# Altium schematic sheet MCU.SchDoc: MCU
size A2; DocumentNumber: 4; SheetNumber: 4; SheetTotal: 9
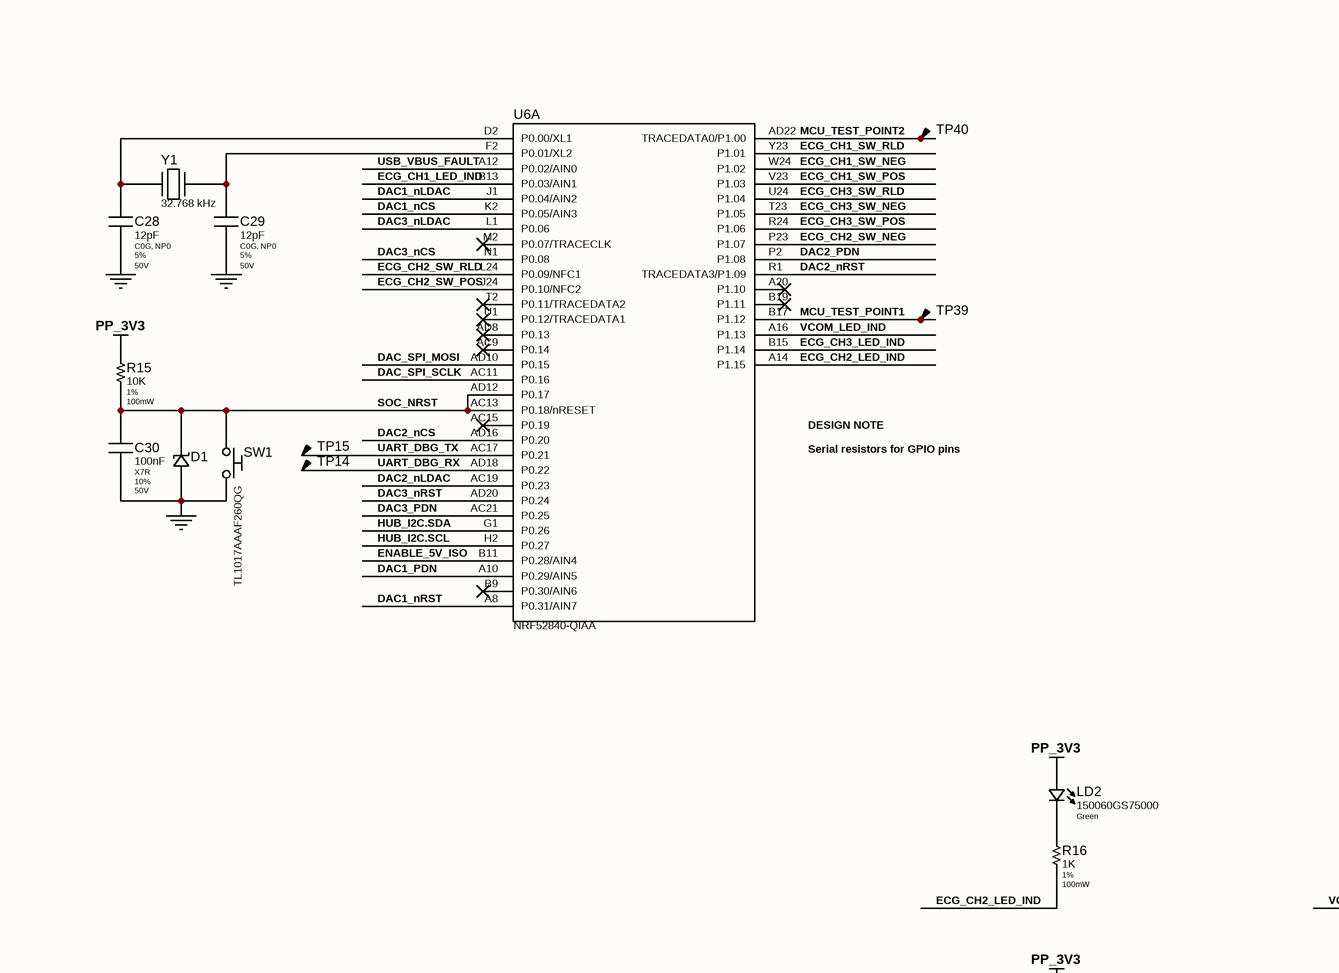
[diagram p0: MCU.SchDoc, top left]
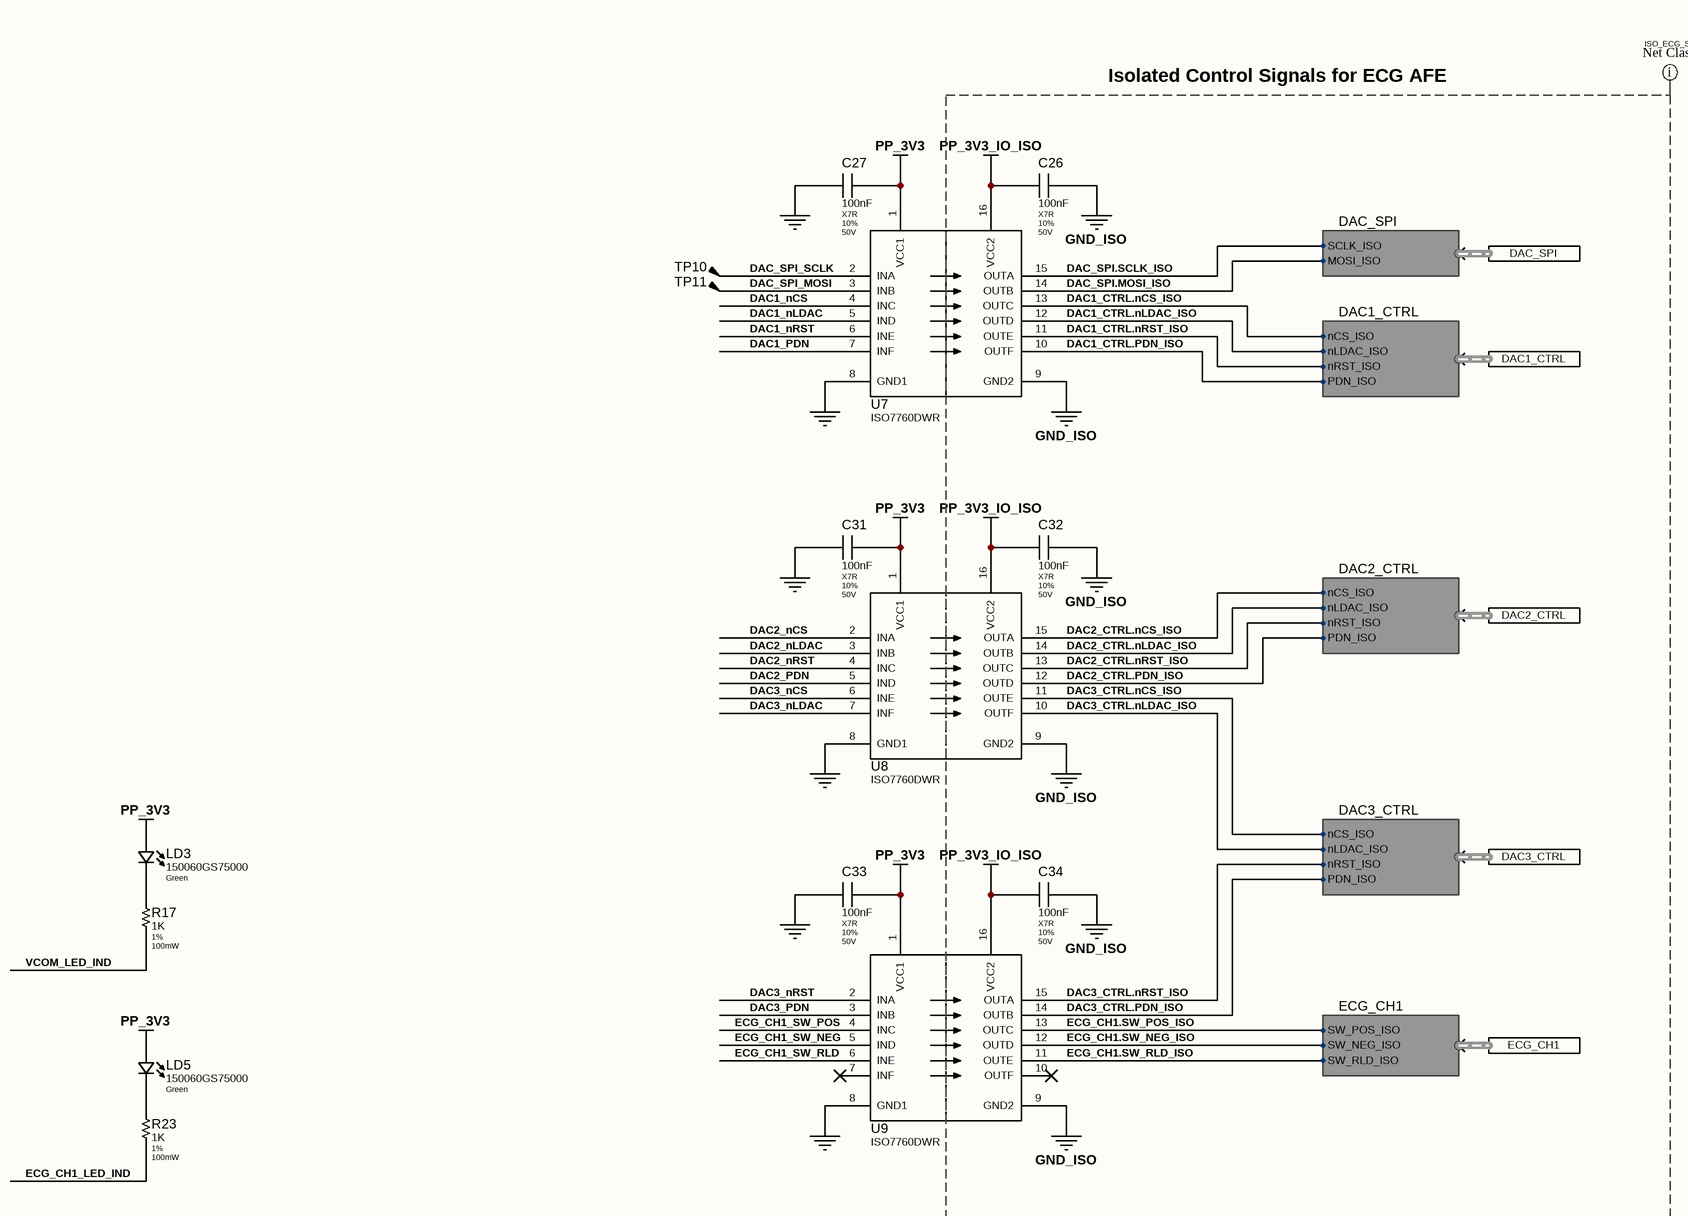
[diagram p1: MCU.SchDoc, top right]
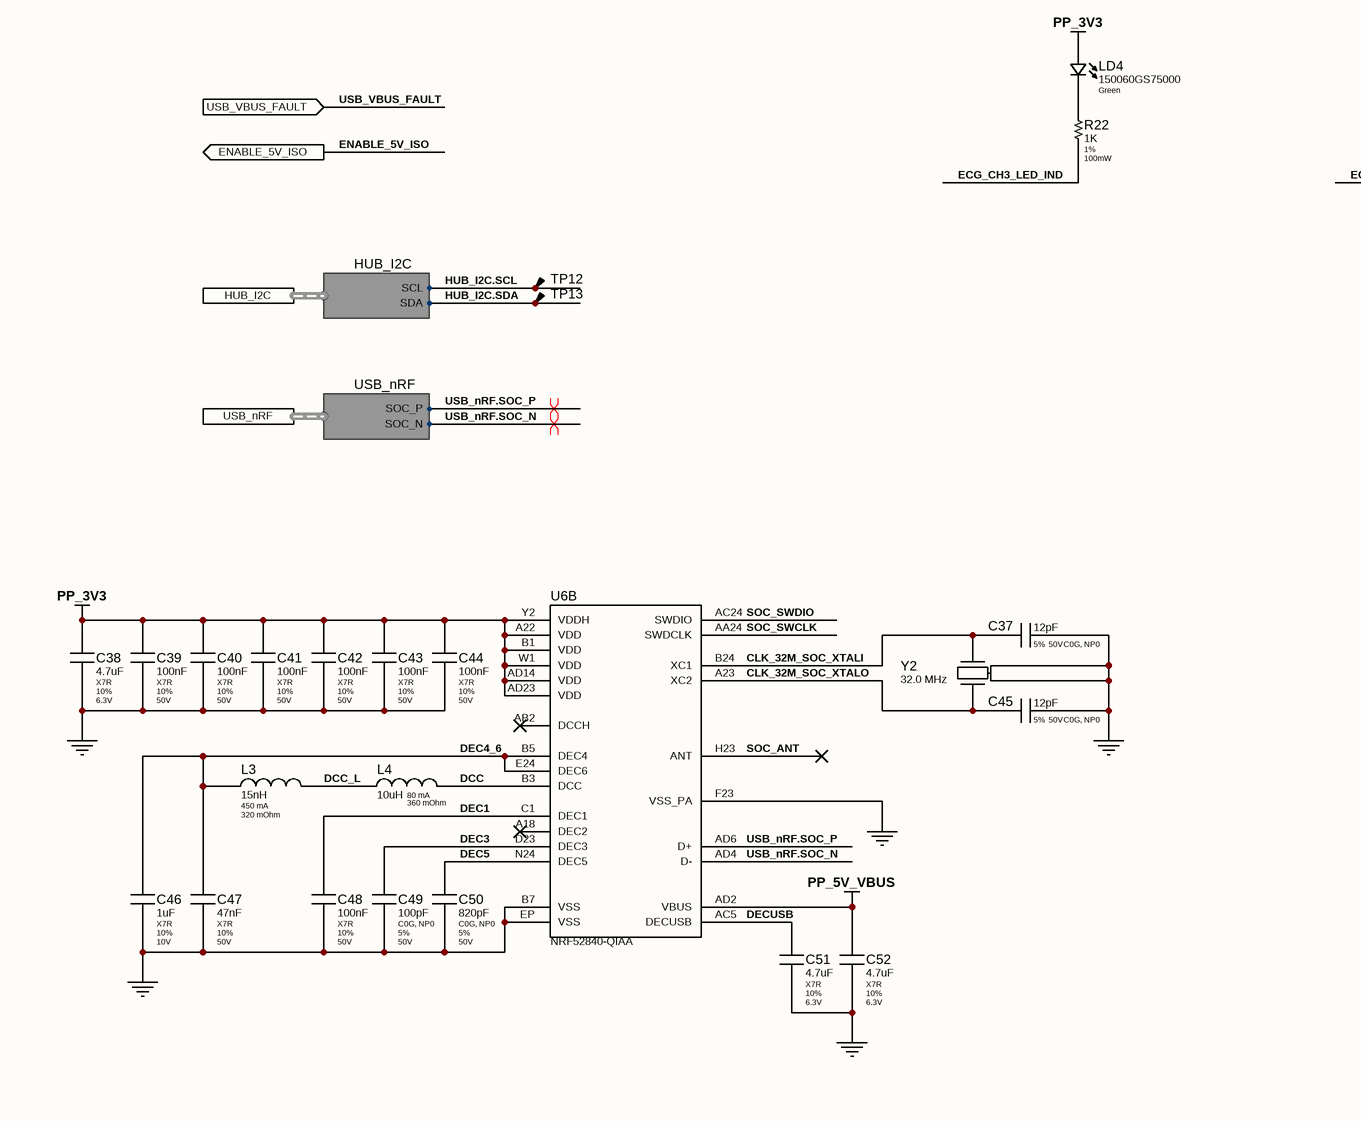
[diagram p2: MCU.SchDoc, bottom left]
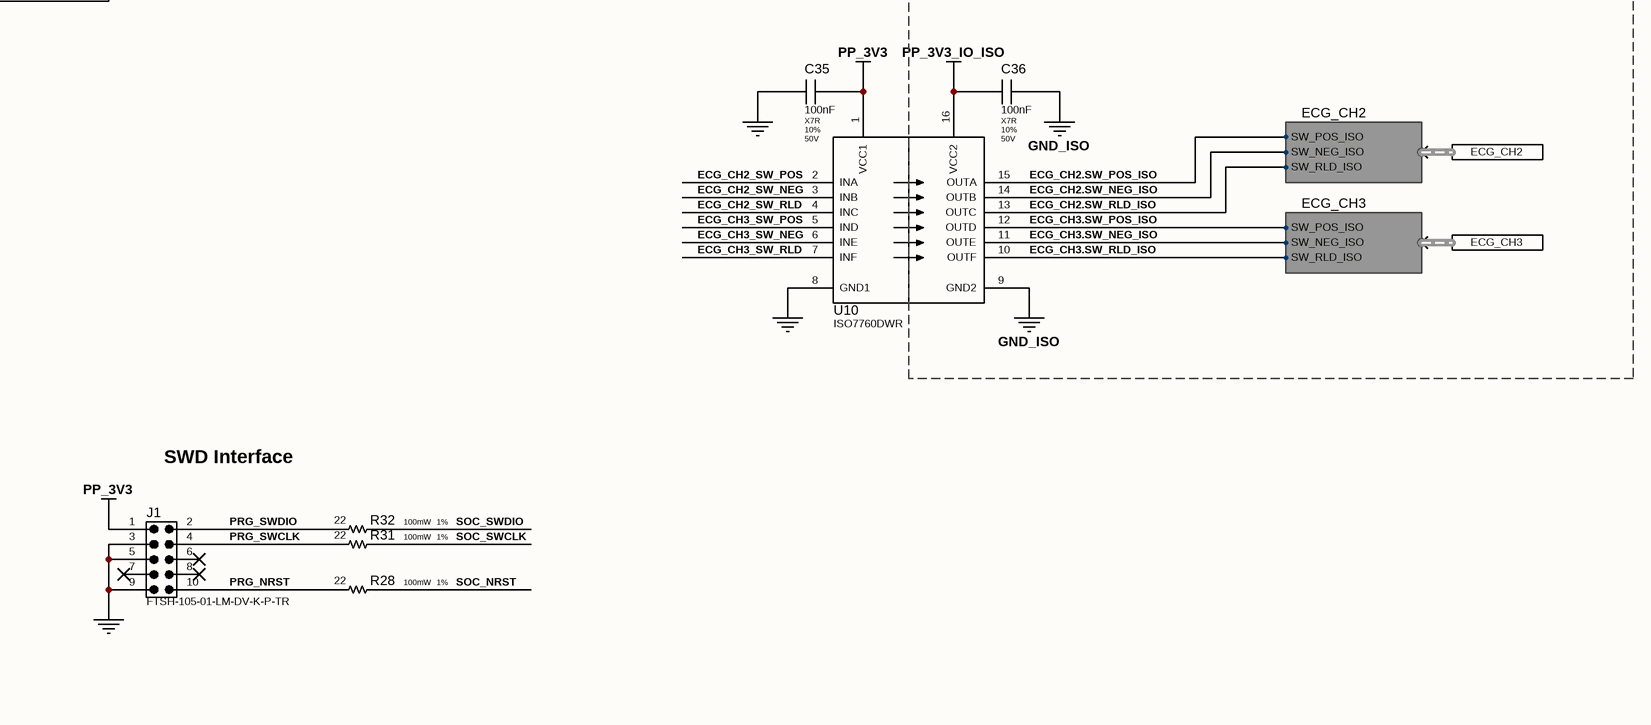
[diagram p3: MCU.SchDoc, bottom right]

## Parts
C26  100nF  Dielectric: X7R  Tolerance: 10%  Voltage: 50V  [MLCC-0402-L]
C27  100nF  Dielectric: X7R  Tolerance: 10%  Voltage: 50V  [MLCC-0402-L]
C28  12pF  Dielectric: C0G, NP0  Tolerance: 5%  Voltage: 50V  [MLCC-0402-N]
C29  12pF  Dielectric: C0G, NP0  Tolerance: 5%  Voltage: 50V  [MLCC-0402-N]
C30  100nF  Dielectric: X7R  Tolerance: 10%  Voltage: 50V  [MLCC-0402-L]
C31  100nF  Dielectric: X7R  Tolerance: 10%  Voltage: 50V  [MLCC-0402-L]
C32  100nF  Dielectric: X7R  Tolerance: 10%  Voltage: 50V  [MLCC-0402-L]
C33  100nF  Dielectric: X7R  Tolerance: 10%  Voltage: 50V  [MLCC-0402-L]
C34  100nF  Dielectric: X7R  Tolerance: 10%  Voltage: 50V  [MLCC-0402-L]
C35  100nF  Dielectric: X7R  Tolerance: 10%  Voltage: 50V  [MLCC-0402-L]
C36  100nF  Dielectric: X7R  Tolerance: 10%  Voltage: 50V  [MLCC-0402-L]
C37  12pF  Dielectric: C0G, NP0  Tolerance: 5%  Voltage: 50V  [MLCC-0402-L]
C38  4.7uF  Dielectric: X7R  Tolerance: 10%  Voltage: 6.3V  [MLCC-0603-L]
C39  100nF  Dielectric: X7R  Tolerance: 10%  Voltage: 50V  [MLCC-0402-L]
C40  100nF  Dielectric: X7R  Tolerance: 10%  Voltage: 50V  [MLCC-0402-L]
C41  100nF  Dielectric: X7R  Tolerance: 10%  Voltage: 50V  [MLCC-0402-L]
C42  100nF  Dielectric: X7R  Tolerance: 10%  Voltage: 50V  [MLCC-0402-L]
C43  100nF  Dielectric: X7R  Tolerance: 10%  Voltage: 50V  [MLCC-0402-L]
C44  100nF  Dielectric: X7R  Tolerance: 10%  Voltage: 50V  [MLCC-0402-L]
C45  12pF  Dielectric: C0G, NP0  Tolerance: 5%  Voltage: 50V  [MLCC-0402-L]
C46  1uF  Dielectric: X7R  Tolerance: 10%  Voltage: 10V  [MLCC-0402-N]
C47  47nF  Dielectric: X7R  Tolerance: 10%  Voltage: 50V  [MLCC-0402-L]
C48  100nF  Dielectric: X7R  Tolerance: 10%  Voltage: 50V  [MLCC-0402-L]
C49  100pF  Dielectric: C0G, NP0  Tolerance: 5%  Voltage: 50V  [MLCC-0402-L]
C50  820pF  Dielectric: C0G, NP0  Tolerance: 5%  Voltage: 50V  [MLCC-0402-L]
C51  4.7uF  Dielectric: X7R  Tolerance: 10%  Voltage: 6.3V  [MLCC-0603-L]
C52  4.7uF  Dielectric: X7R  Tolerance: 10%  Voltage: 6.3V  [MLCC-0603-L]
D1  SZESD9101P2T5G  [SOD-923]  (value not drawn)
J1  FTSH-105-01-LM-DV-K-P-TR  [FTSH-105-01-X-DV-K]
L3  15nH  Current: 450 mA  ESR: 320 mOhm  [FB-0402-L]
L4  10uH  Current: 80 mA  ESR: 360 mOhm  [FB-0603-L]
LD2  150060GS75000  Colour: Green  [LED-0603-GREEN]
LD3  150060GS75000  Colour: Green  [LED-0603-GREEN]
LD4  150060GS75000  Colour: Green  [LED-0603-GREEN]
LD5  150060GS75000  Colour: Green  [LED-0603-GREEN]
R15  10K  Tolerance: 1%  Power: 100mW  [RES-0402-N]
R16  1K  Tolerance: 1%  Power: 100mW  [RES-0402-N]
R17  1K  Tolerance: 1%  Power: 100mW  [RES-0402-N]
R22  1K  Tolerance: 1%  Power: 100mW  [RES-0402-N]
R23  1K  Tolerance: 1%  Power: 100mW  [RES-0402-N]
R28  22  Tolerance: 1%  Power: 100mW  [RES-0402-N]
R31  22  Tolerance: 1%  Power: 100mW  [RES-0402-N]
R32  22  Tolerance: 1%  Power: 100mW  [RES-0402-N]
SW1  TL1017AAAF260QG  [TL1017AAAF260QG]
TP10  TP-SMT-CIRCLE  [TP-0.8mm]  (value not drawn)  (no BOM)
TP11  TP-SMT-CIRCLE  [TP-0.8mm]  (value not drawn)  (no BOM)
TP12  TP-SMT-CIRCLE  [TP-0.8mm]  (value not drawn)  (no BOM)
TP13  TP-SMT-CIRCLE  [TP-0.8mm]  (value not drawn)  (no BOM)
TP14  TP-SMT-CIRCLE  [TP-1.0mm]  (value not drawn)  (no BOM)
TP15  TP-SMT-CIRCLE  [TP-1.0mm]  (value not drawn)  (no BOM)
TP39  TP-SMT-CIRCLE  [TP-0.8mm]  (value not drawn)  (no BOM)
TP40  TP-SMT-CIRCLE  [TP-0.8mm]  (value not drawn)  (no BOM)
U6  NRF52840-QIAA  [NRF52840-QIAA]  (parts A,B of 2)
U7  ISO7760DWR  [TI SOIC-16 ISOLATED]
U8  ISO7760DWR  [TI SOIC-16 ISOLATED]
U9  ISO7760DWR  [TI SOIC-16 ISOLATED]
U10  ISO7760DWR  [TI SOIC-16 ISOLATED]
Y1  32.768 kHz  [XTAL-2.0x1.2]
Y2  32.0 MHz  [XTAL-2.0x1.6]

## Ports
DAC1_CTRL (harness DAC1_CTRL), DAC2_CTRL (harness DAC2_CTRL), DAC3_CTRL (harness DAC3_CTRL), DAC_SPI (harness DAC_SPI), ECG_CH1 (harness ECG_CH1), ECG_CH2 (harness ECG_CH2), ECG_CH3 (harness ECG_CH3), ENABLE_5V_ISO (out), HUB_I2C (harness HUB_I2C), USB_nRF (harness USB_nRF), USB_VBUS_FAULT (in)

## Harnesses
USB_nRF: SOC_P, SOC_N
DAC_SPI: MOSI_ISO, SCLK_ISO
DAC1_CTRL: nLDAC_ISO, nCS_ISO, nRST_ISO, PDN_ISO
DAC2_CTRL: nLDAC_ISO, nCS_ISO, nRST_ISO, PDN_ISO
HUB_I2C: SCL, SDA
ECG_CH2: SW_NEG_ISO, SW_POS_ISO, SW_RLD_ISO
ECG_CH1: SW_NEG_ISO, SW_POS_ISO, SW_RLD_ISO
DAC3_CTRL: nLDAC_ISO, nCS_ISO, nRST_ISO, PDN_ISO
ECG_CH3: SW_NEG_ISO, SW_POS_ISO, SW_RLD_ISO

## Nets
GND: C27.1 C28.2 C29.2 C30.2 C31.1 C33.1 C35.1 C37.2 C38.2 C39.2 C40.2 C41.2 C42.2 C43.2 C44.2 C45.2 C46.2 C47.2 C48.2 C49.2 C50.2 C51.2 C52.2 D1.A J1.3 J1.5 J1.9 SW1.2 U6.B7(VSS) U6.EP(VSS) U6.F23(VSS_PA) U7.8(GND1) U8.8(GND1) U9.8(GND1) U10.8(GND1) Y2.2 Y2.4
GND_ISO: C26.2 C32.2 C34.2 C36.2 U7.9(GND2) U8.9(GND2) U9.9(GND2) U10.9(GND2)
PP_3V3: C27.2 C31.2 C33.2 C35.2 C38.1 C39.1 C40.1 C41.1 C42.1 C43.1 C44.1 J1.1 LD2.A LD3.A LD4.A LD5.A R15.1 U6.A22(VDD) U6.AD14(VDD) U6.AD23(VDD) U6.B1(VDD) U6.W1(VDD) U6.Y2(VDDH) U7.1(VCC1) U8.1(VCC1) U9.1(VCC1) U10.1(VCC1)
PP_3V3_IO_ISO: C26.1 C32.1 C34.1 C36.1 U7.16(VCC2) U8.16(VCC2) U9.16(VCC2) U10.16(VCC2)
PP_5V_VBUS: C52.1 U6.AD2(VBUS)
CLK_32M_SOC_XTALI: C37.1 U6.B24(XC1) Y2.3
CLK_32M_SOC_XTALO: C45.1 U6.A23(XC2) Y2.1
DAC1_CTRL.nCS_ISO: U7.13(OUTC) ; port DAC1_CTRL.nCS_ISO
DAC1_CTRL.nLDAC_ISO: U7.12(OUTD) ; port DAC1_CTRL.nLDAC_ISO
DAC1_CTRL.nRST_ISO: U7.11(OUTE) ; port DAC1_CTRL.nRST_ISO
DAC1_CTRL.PDN_ISO: U7.10(OUTF) ; port DAC1_CTRL.PDN_ISO
DAC1_nCS: U6.K2(P0.05/AIN3) U7.4(INC)
DAC1_nLDAC: U6.J1(P0.04/AIN2) U7.5(IND)
DAC1_nRST: U6.A8(P0.31/AIN7) U7.6(INE)
DAC1_PDN: U6.A10(P0.29/AIN5) U7.7(INF)
DAC2_CTRL.nCS_ISO: U8.15(OUTA) ; port DAC2_CTRL.nCS_ISO
DAC2_CTRL.nLDAC_ISO: U8.14(OUTB) ; port DAC2_CTRL.nLDAC_ISO
DAC2_CTRL.nRST_ISO: U8.13(OUTC) ; port DAC2_CTRL.nRST_ISO
DAC2_CTRL.PDN_ISO: U8.12(OUTD) ; port DAC2_CTRL.PDN_ISO
DAC2_nCS: U6.AD16(P0.20) U8.2(INA)
DAC2_nLDAC: U6.AC19(P0.23) U8.3(INB)
DAC2_nRST: U6.R1(TRACEDATA3/P1.09) U8.4(INC)
DAC2_PDN: U6.P2(P1.08) U8.5(IND)
DAC3_CTRL.nCS_ISO: U8.11(OUTE) ; port DAC3_CTRL.nCS_ISO
DAC3_CTRL.nLDAC_ISO: U8.10(OUTF) ; port DAC3_CTRL.nLDAC_ISO
DAC3_CTRL.nRST_ISO: U9.15(OUTA) ; port DAC3_CTRL.nRST_ISO
DAC3_CTRL.PDN_ISO: U9.14(OUTB) ; port DAC3_CTRL.PDN_ISO
DAC3_nCS: U6.N1(P0.08) U8.6(INE)
DAC3_nLDAC: U6.L1(P0.06) U8.7(INF)
DAC3_nRST: U6.AD20(P0.24) U9.2(INA)
DAC3_PDN: U6.AC21(P0.25) U9.3(INB)
DAC_SPI.MOSI_ISO: U7.14(OUTB) ; port DAC_SPI.MOSI_ISO
DAC_SPI.SCLK_ISO: U7.15(OUTA) ; port DAC_SPI.SCLK_ISO
DAC_SPI_MOSI: TP11.1 U6.AD10(P0.15) U7.3(INB)
DAC_SPI_SCLK: TP10.1 U6.AC11(P0.16) U7.2(INA)
DCC: L4.1 U6.B3(DCC)
DCC_L: L3.2 L4.2
DEC1: C48.1 U6.C1(DEC1)
DEC3: C49.1 U6.D23(DEC3)
DEC4_6: C46.1 C47.1 L3.1 U6.B5(DEC4) U6.E24(DEC6)
DEC5: C50.1 U6.N24(DEC5)
DECUSB: C51.1 U6.AC5(DECUSB)
ECG_CH1.SW_NEG_ISO: U9.12(OUTD) ; port ECG_CH1.SW_NEG_ISO
ECG_CH1.SW_POS_ISO: U9.13(OUTC) ; port ECG_CH1.SW_POS_ISO
ECG_CH1.SW_RLD_ISO: U9.11(OUTE) ; port ECG_CH1.SW_RLD_ISO
ECG_CH1_LED_IND: R23.2 U6.B13(P0.03/AIN1)
ECG_CH1_SW_NEG: U6.W24(P1.02) U9.5(IND)
ECG_CH1_SW_POS: U6.V23(P1.03) U9.4(INC)
ECG_CH1_SW_RLD: U6.Y23(P1.01) U9.6(INE)
ECG_CH2.SW_NEG_ISO: U10.14(OUTB) ; port ECG_CH2.SW_NEG_ISO
ECG_CH2.SW_POS_ISO: U10.15(OUTA) ; port ECG_CH2.SW_POS_ISO
ECG_CH2.SW_RLD_ISO: U10.13(OUTC) ; port ECG_CH2.SW_RLD_ISO
ECG_CH2_LED_IND: R16.2 U6.A14(P1.15)
ECG_CH2_SW_NEG: U6.P23(P1.07) U10.3(INB)
ECG_CH2_SW_POS: U6.J24(P0.10/NFC2) U10.2(INA)
ECG_CH2_SW_RLD: U6.L24(P0.09/NFC1) U10.4(INC)
ECG_CH3.SW_NEG_ISO: U10.11(OUTE) ; port ECG_CH3.SW_NEG_ISO
ECG_CH3.SW_POS_ISO: U10.12(OUTD) ; port ECG_CH3.SW_POS_ISO
ECG_CH3.SW_RLD_ISO: U10.10(OUTF) ; port ECG_CH3.SW_RLD_ISO
ECG_CH3_LED_IND: R22.2 U6.B15(P1.14)
ECG_CH3_SW_NEG: U6.T23(P1.05) U10.6(INE)
ECG_CH3_SW_POS: U6.R24(P1.06) U10.5(IND)
ECG_CH3_SW_RLD: U6.U24(P1.04) U10.7(INF)
ENABLE_5V_ISO: U6.B11(P0.28/AIN4) ; port ENABLE_5V_ISO
HUB_I2C.SCL: TP12.1 U6.H2(P0.27) ; port HUB_I2C.SCL
HUB_I2C.SDA: TP13.1 U6.G1(P0.26) ; port HUB_I2C.SDA
MCU_TEST_POINT1: TP39.1 U6.B17(P1.12)
MCU_TEST_POINT2: TP40.1 U6.AD22(TRACEDATA0/P1.00)
PRG_NRST: J1.10 R28.1
PRG_SWCLK: J1.4 R31.1
PRG_SWDIO: J1.2 R32.1
SOC_ANT: U6.H23(ANT)
SOC_NRST: C30.1 D1.K R15.2 R28.2 SW1.1 U6.AC13(P0.18/nRESET) U6.AD12(P0.17)
SOC_SWCLK: R31.2 U6.AA24(SWDCLK)
SOC_SWDIO: R32.2 U6.AC24(SWDIO)
UART_DBG_RX: TP14.1 U6.AD18(P0.22)
UART_DBG_TX: TP15.1 U6.AC17(P0.21)
USB_nRF.SOC_N: U6.AD4(D-) ; port USB_nRF.SOC_N
USB_nRF.SOC_P: U6.AD6(D+) ; port USB_nRF.SOC_P
USB_VBUS_FAULT: U6.A12(P0.02/AIN0) ; port USB_VBUS_FAULT
VCOM_LED_IND: R17.2 U6.A16(P1.13)
NetC28_1: C28.1 U6.D2(P0.00/XL1) Y1.2
NetC29_1: C29.1 U6.F2(P0.01/XL2) Y1.1
NetLD2_K: LD2.K R16.1
NetLD3_K: LD3.K R17.1
NetLD4_K: LD4.K R22.1
NetLD5_K: LD5.K R23.1

Not connected (* = marked no-connect by the designer): J1 6* 7* 8*; U6 A18(DEC2)* A20(P1.10)* AB2(DCCH)* AC9(P0.14)* AC15(P0.19)* AD8(P0.13)* B9(P0.30/AIN6)* B19(P1.11)* M2(P0.07/TRACECLK)* T2(P0.11/TRACEDATA2)* U1(P0.12/TRACEDATA1)*; U9 7(INF)* 10(OUTF)*

## Layout directives
differential pair: USB_nRF.SOC_N, USB_nRF.SOC_P
net class ISO_ECG_SIGNAL: DAC1_CTRL.nCS_ISO, DAC1_CTRL.nLDAC_ISO, DAC1_CTRL.nRST_ISO, DAC1_CTRL.PDN_ISO, DAC2_CTRL.nCS_ISO, DAC2_CTRL.nLDAC_ISO, DAC2_CTRL.nRST_ISO, DAC2_CTRL.PDN_ISO, DAC3_CTRL.nCS_ISO, DAC3_CTRL.nLDAC_ISO, DAC3_CTRL.nRST_ISO, DAC3_CTRL.PDN_ISO, DAC_SPI.MOSI_ISO, DAC_SPI.SCLK_ISO, ECG_CH1.SW_NEG_ISO, ECG_CH1.SW_POS_ISO, ECG_CH1.SW_RLD_ISO, ECG_CH2.SW_NEG_ISO, ECG_CH2.SW_POS_ISO, ECG_CH2.SW_RLD_ISO, ECG_CH3.SW_NEG_ISO, ECG_CH3.SW_POS_ISO, ECG_CH3.SW_RLD_ISO, GND_ISO, PP_3V3_IO_ISO

## Notes on the sheet
- Isolated Control Signals for ECG AFE
- (near U6) DESIGN NOTE
  Serial resistors for GPIO pins
- SWD Interface
- THIS DOCUMENT IS UNCONTROLLED WHEN PRINTED
- COMMERCIAL IN CONFIDENCE
- CLIENT
- PROJECT
- PART NAME
- TITLE
- SHEET SIZE
- SHEET
- DATE
- A2
- FILE
- PROJECT CODE
- PART / DWG No.
- REV
- VARIANT
- AUTHOR

## Library data of the parts
C26 C27 C30-C36 C39-C44 C48 = CMP-0000000712-3: CAP-CER-100nF-50V-0402-X7R-10%; Value: 100nF
C28 C29 C37 C45 = CMP-0000000721-3: CAP-CER-12pF-50V-0402-NP0-5%; Value: 12pF
C38 C51 C52 = CMP-0000000635-4: CAP-CER-4.7uF-6.3V-0603-X7R-10%; Value: 4.7uF
C46 = CMP-0000002778-1: CAP-CER-1uF-10V-0402-X7R-10%; Value: 1uF
C47 = CMP-0000000775-3: CAP-CER-47nF-50V-0402-X7R-10%; Value: 47nF
C49 = CMP-0000000714-3: CAP-CER-100pF-50V-0402-NP0-5%; Value: 100pF
C50 = CMP-0000000798-3: CAP-CER-820pF-50V-0402-NP0-5%; Value: 820pF
D1 = CMP-0000001898-5: DIODE-TVS-5V-SZESD9101P2T5G; Manufacturer: onsemi; Voltage - Clamping: 7V; Current: 16A; Voltage - Reverse: 5V; Voltage - Breakdown: 5.3V; Type: TVS; Manufacturer Part Number: SZESD9101P2T5G; ComponentLink1URL: https://www.onsemi.com/pdf/datasheet/esd9101-d.pdf; ComponentLink1Description: Datasheet
J1 = CMP-0000001058-3: CONN-SAMTEC-FTSH-2x5-FTSH-105-01-LM-DV-K-P-TR; Manufacturer: Samtec; ComponentLink1Description: Datasheet; Manufacturer Part Number: FTSH-105-01-LM-DV-K-P-TR; ComponentLink1URL: https://suddendocs.samtec.com/prints/ftsh-1xx-xx-xxx-dv-xxx-xxx-x-xx-mkt.pdf
L3 = CMP-00010-1: IND-15nH-450mA-320mOhm-5%-0402; Manufacturer: Murata Electronics; Manufacturer Part Number: LQG15HS15NJ02D; Tolerance: ±5%; Value: 15nH
L4 = CMP-00001-4: IND-10uH-80mA-360mOhm-20%-0603; Manufacturer: Taiyo Yuden; Manufacturer Part Number: LBMF1608T100M; Tolerance: ±20%; Value: 10uH
LD2-LD5 = CMP-0000001161-5: LED-GREEN-150060GS75000; Manufacturer: Wurth Elektronik; Forward Current: 20mA; Forward Voltage: 3.2V; ComponentLink1Description: Datasheet; ComponentLink1URL: https://au.mouser.com/datasheet/2/445/150060GS75000-1714120.pdf; Manufacturer Part Number: 150060GS75000
R15 = CMP-0000001609-1: RES-10K-0402-1%-100mW; Value: 10K
R16 R17 R22 R23 = CMP-0000000864-1: RES-1K-0402-1%-100mW; Value: 1K
R28 R31 R32 = CMP-0000001303-1: RES-22-0402-1%-100mW; Value: 22
SW1 = CMP-0000002876-1: SWITCH-TACTILE-SPST-NO-3mm x 2.5mm-TL1017AAAF260QG; Manufacturer: E-Switch; Datasheet: https://configured-product-images.s3.amazonaws.com/Datasheets/TL1017.pdf; Manufacturer Part Number: TL1017AAAF260QG
TP10-TP15 TP39 TP40 = CMP-0000000822-22: Test Point, Circular SMT Style
U6 = CMP-0000000638-9: IC-RF-NRF52840-QIAA; Manufacturer: Nordic Semiconductor ASA; Manufacturer Part Number: NRF52840-QIAA; ComponentLink1Description: Datasheet; ComponentLink1URL: https://infocenter.nordicsemi.com/pdf/nRF52840_PS_v1.2.pdf
U7-U10 = CMP-0000003489-2: IC-DIGITAL-ISOLATOR-ISO7760DWR; Manufacturer: Texas Instruments; ComponentLink1URL: https://www.ti.com/lit/ds/symlink/iso7760.pdf?ts=1712058534565&ref_url=https%253A%252F%252Fwww.ti.com%252Fsitesearch%252Fen-us%252Fdocs%252Funiversalsearch.tsp%253FlangPref%253Den-US%2526searchTerm%253DISO7760DBQR%2526nr%253D9; Manufacturer Part Number: ISO7760DWR; ComponentLink1Description: Datasheet
Y1 = CMP-00002-2: XTAL-32.768kHz-10ppm-9pF-2.0x1.2; Manufacturer: Würth Elektronik; Manufacturer Part Number: 830062558; Load Capacitance: 9pF; Tolerance: 10ppm; ComponentLink1Description: Datasheet; Value: 32.768 kHz; ComponentLink1URL: https://www.we-online.com/components/products/datasheet/830062558.pdf
Y2 = CMP-00000-5: XTAL-32MHz-10ppm-8pF-2.0x1.6; Manufacturer: Würth Elektronik; Manufacturer Part Number: 830108212909; Stability: ±15ppm; Tolerance: ±10ppm; Load Capacitance: 8pF; Value: 32.0 MHz